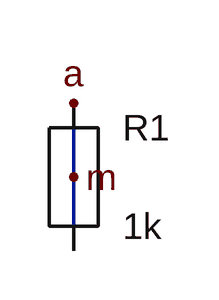
[diagram p0: schematic same_instance_label_at_vertex.asc]
same_instance_label_at_vertex.asc, the LTspice schematic file:
Version 4
SHEET 1 880 680
WIRE 96 96 96 144
WIRE 96 144 96 192
FLAG 96 96 a
FLAG 96 144 m
SYMBOL res 96 144 R0
SYMATTR InstName R1
SYMATTR Value 1k

The netlist it stands for:
* same_instance_label_at_vertex.asc
R1 m m 1k
.backanno
.end